# Altium schematic sheet 02_test1.SchDoc
size A3; SheetNumber: 1; SheetTotal: 1
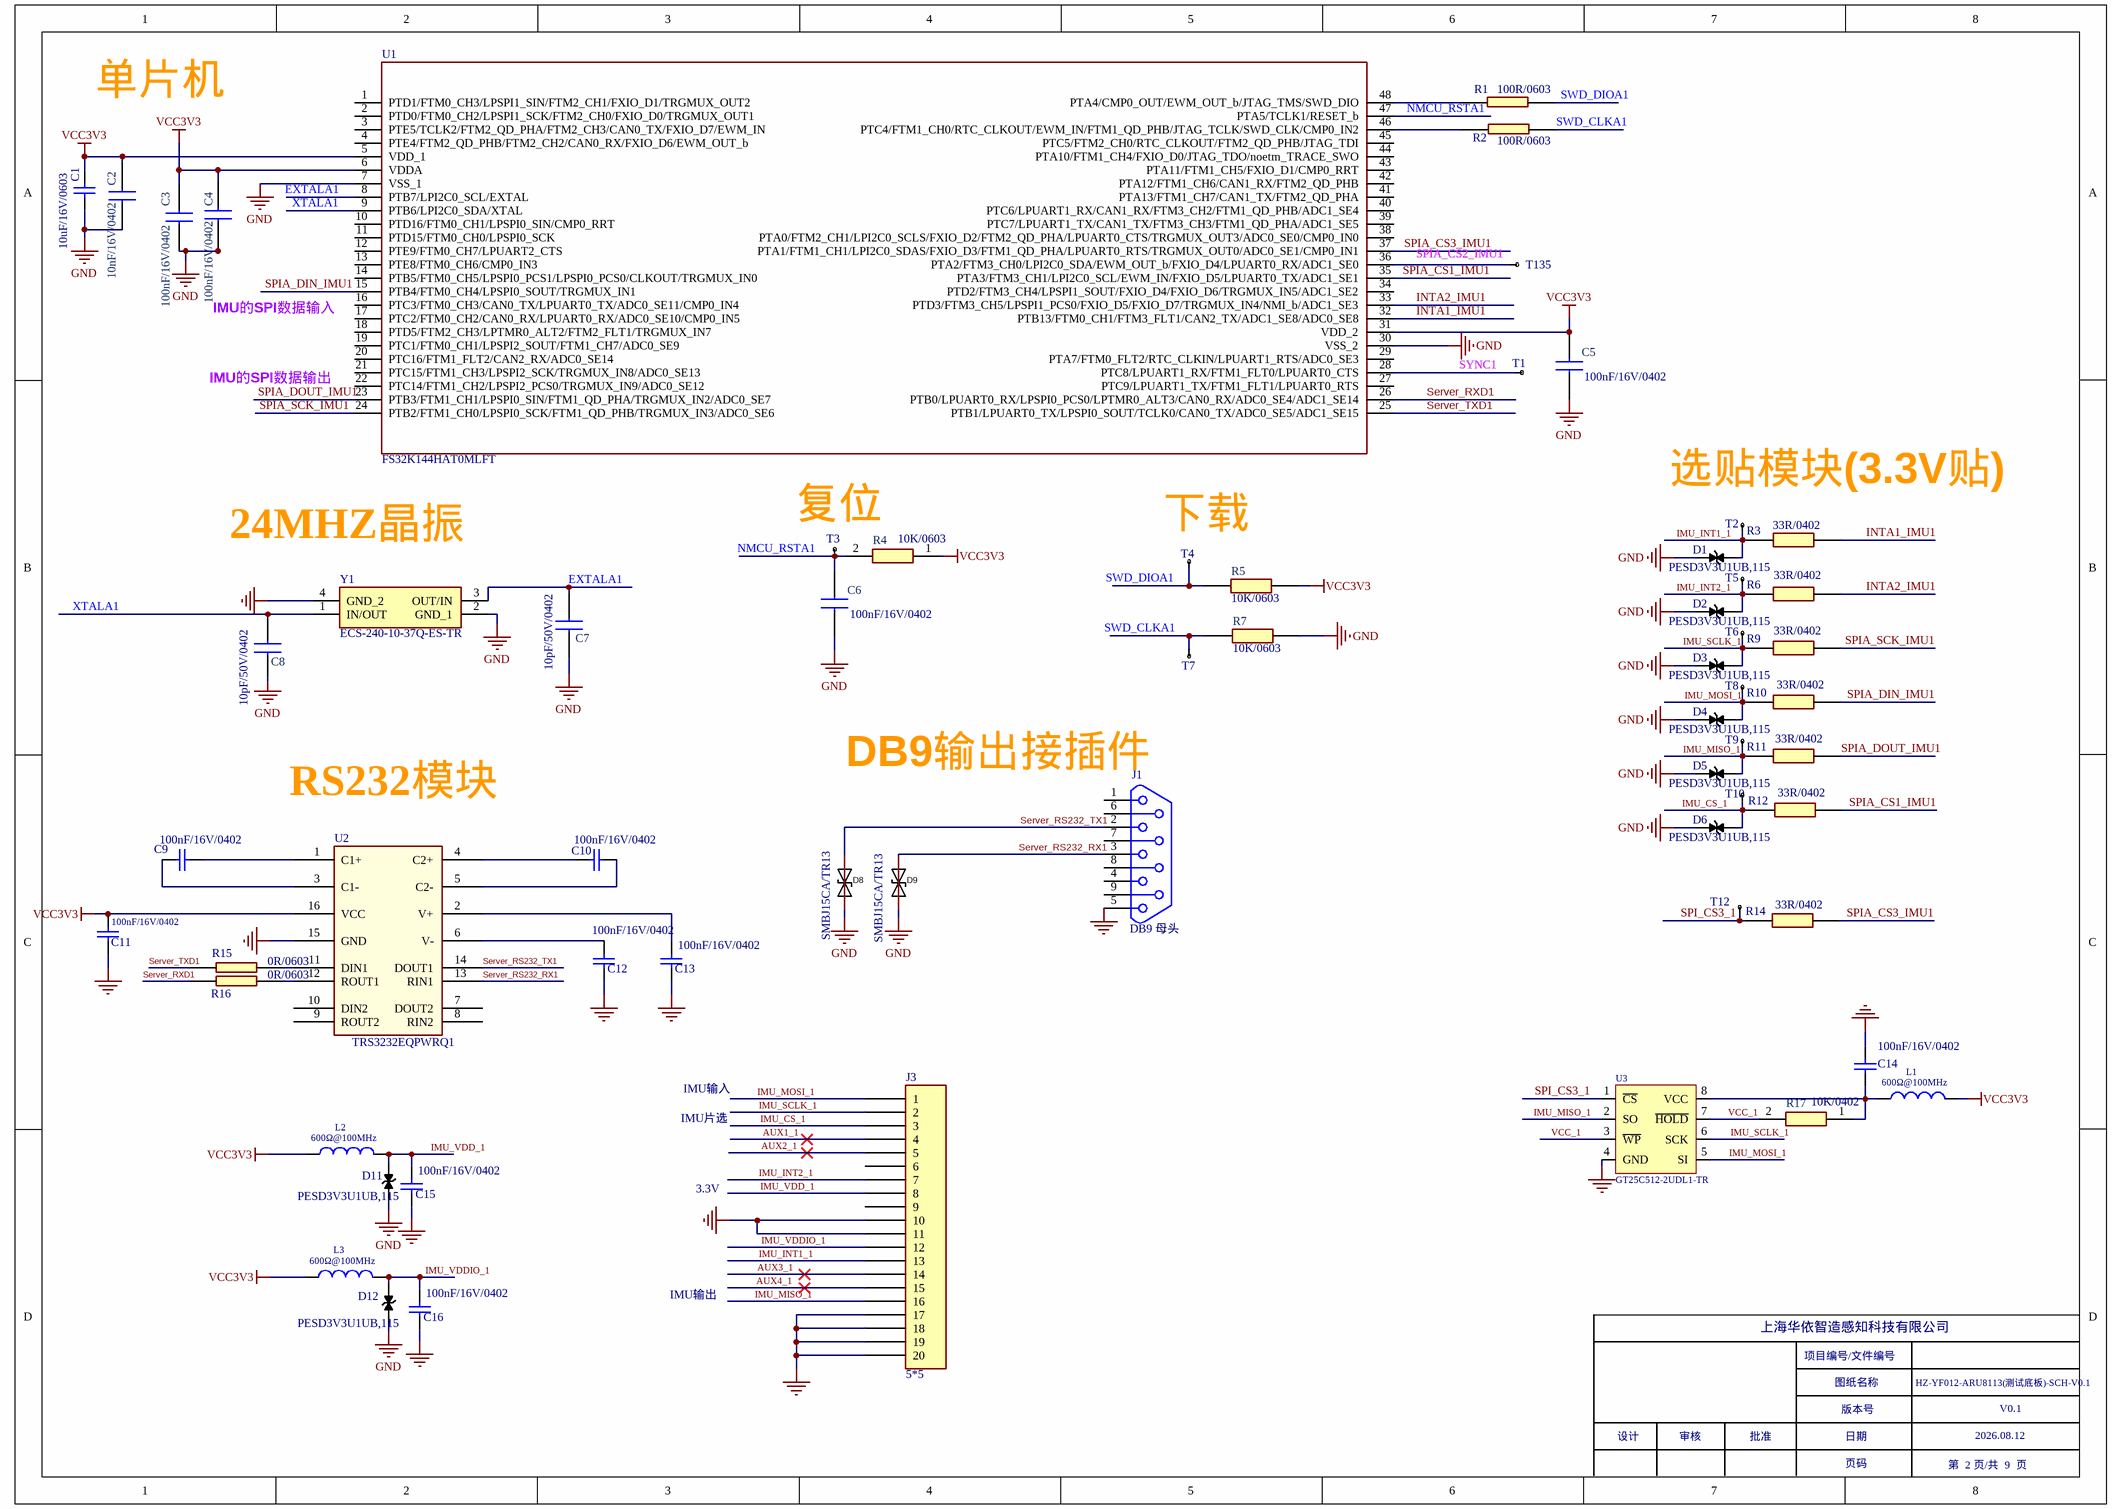
[diagram p0: 02_test1.SchDoc]

## Parts
C1  10uF/16V/0603  [C 0603_L]
C2  10nF/16V/0402  [C 0402_L]
C3  100nF/16V/0402  [C 0402_L]
C4  100nF/16V/0402  [C 0402_L]
C5  100nF/16V/0402  [C 0402_L]
C6  100nF/16V/0402  [C 0402_L]
C7  10pF/50V/0402  [C 0402_L]
C8  10pF/50V/0402  [C 0402_L]
C9  100nF/16V/0402  [C 0402_L]
C10  100nF/16V/0402  [C 0402_L]
C11  value 100nF/16V/0402  [C 0402_L]  (hidden comment: Cap)
C12  100nF/16V/0402  [C 0402_L]
C13  100nF/16V/0402  [C 0402_L]
C14  100nF/16V/0402  [C 0402_L]
C15  100nF/16V/0402  [C 0402_L]
C16  100nF/16V/0402  [0402C]
D1  PESD3V3U1UB,115  [SOD-523]
D2  PESD3V3U1UB,115  [SOD-523]
D3  PESD3V3U1UB,115  [SOD-523]
D4  PESD3V3U1UB,115  [SOD-523]
D5  PESD3V3U1UB,115  [SOD-523]
D6  PESD3V3U1UB,115  [SOD-523]
D8  SMBJ15CA/TR13  [SMB]
D9  SMBJ15CA/TR13  [SMB]
D11  PESD3V3U1UB,115  [PESD3V3U1UB,115]
D12  PESD3V3U1UB,115  [PESD3V3U1UB,115]
J1  DB9 母头  [DB9-RS8R1-2R77]
J3  5*5  [5*5-socket]
L1  value 600Ω@100MHz  [0603L]  (hidden comment: Inductor)
L2  value 600Ω@100MHz  [0603L]  (hidden comment: Inductor)
L3  value 600Ω@100MHz  [0603L]  (hidden comment: Inductor)
R1  100R/0603  [R 0603_L]
R2  100R/0603  [R 0603_L]
R3  33R/0402  [0402R]
R4  10K/0603  [R 0603_L]
R5  10K/0603  [R 0603_L]
R6  33R/0402  [0402R]
R7  10K/0603  [R 0603_L]
R9  33R/0402  [0402R]
R10  33R/0402  [0402R]
R11  33R/0402  [0402R]
R12  33R/0402  [0402R]
R14  33R/0402  [0402R]
R15  0R/0603  [R 0603_L]
R16  0R/0603  [R 0603_L]
R17  10K/0402  [0402R]
T1  TEST  [Test-0.5mm]  (value not drawn)
T2  TEST  [TEST]  (value not drawn)
T3  TEST  [TEST]  (value not drawn)
T4  TEST  [TEST]  (value not drawn)
T5  TEST  [TEST]  (value not drawn)
T6  TEST  [TEST]  (value not drawn)
T7  TEST  [TEST]  (value not drawn)
T8  TEST  [TEST]  (value not drawn)
T9  TEST  [TEST]  (value not drawn)
T10  TEST  [TEST]  (value not drawn)
T12  TEST  [Test-0.5mm]  (value not drawn)
T135  TEST  [Test-0.5mm]  (value not drawn)
U1  FS32K144HAT0MLFT  [LQFP48_7X7]
U2  TRS3232EQPWRQ1  [TSSOP16_640X500]
U3  GT25C512-2UDL1-TR  [GT25C512-2UDLA2-TR]
Y1  ECS-240-10-37Q-ES-TR  [ECS2401037QESTR]

## Nets
GND: C1.2 C2.1 C3.2 C4.2 C5.2 C6.2 C7.1 C8.1 C11.2 C12.2 C13.2 C14.1 C15.2 C16.2 D1.1 D2.1 D3.1 D4.1 D5.1 D6.1 D8.1 D9.1 D11.1 D12.1 J1.5 J3.10 J3.11 J3.17 J3.18 J3.19 J3.20 R7.1 U1.7(VSS_1) U1.30(VSS_2) U2.15(GND) U3.4(GND) Y1.2(GND_1) Y1.4(GND_2)
VCC3V3: C1.1 C2.2 C3.1 C4.1 C5.1 C11.1 L1.2 L2.1 L3.1 R4.1 R5.1 U1.5(VDD_1) U1.6(VDDA) U1.31(VDD_2) U2.16(VCC)
AUX1_1: J3.4
AUX2_1: J3.5
AUX3_1: J3.14
AUX4_1: J3.15
EXTALA1: C7.2 U1.8(PTB7/LPI2C0_SCL/EXTAL) Y1.3(OUT/IN)
IMU_CS_1: D6.2 J3.3 R12.2 T10.1
IMU_INT1_1: D1.2 J3.13 R3.2 T2.1
IMU_INT2_1: D2.2 J3.7 R6.2 T5.1
IMU_MISO_1: D5.2 J3.16 R11.2 T9.1 U3.2(SO)
IMU_MOSI_1: D4.2 J3.1 R10.2 T8.1 U3.5(SI)
IMU_SCLK_1: D3.2 J3.2 R9.2 T6.1 U3.6(SCK)
IMU_VDD_1: C15.1 D11.2 J3.8 L2.2
IMU_VDDIO_1: C16.1 D12.2 J3.12 L3.2
INTA1_IMU1: R3.1 U1.32(PTB13/FTM0_CH1/FTM3_FLT1/CAN2_TX/ADC1_SE8/ADC0_SE8)
INTA2_IMU1: R6.1 U1.33(PTD3/FTM3_CH5/LPSPI1_PCS0/FXIO_D5/FXIO_D7/TRGMUX_IN4/NMI_b/ADC1_SE3)
NMCU_RSTA1: C6.1 R4.2 T3.1 U1.47(PTA5/TCLK1/RESET_b)
Server_RS232_RX1: D9.2 J1.3 U2.13(RIN1)
Server_RS232_TX1: D8.2 J1.2 U2.14(DOUT1)
Server_RXD1: R16.1 U1.26(PTB0/LPUART0_RX/LPSPI0_PCS0/LPTMR0_ALT3/CAN0_RX/ADC0_SE4/ADC1_SE14)
Server_TXD1: R15.1 U1.25(PTB1/LPUART0_TX/LPSPI0_SOUT/TCLK0/CAN0_TX/ADC0_SE5/ADC1_SE15)
SPI_CS3_1: R14.2 T12.1 U3.1(~{CS})
SPIA_CS1_IMU1: R12.1 U1.35(PTA3/FTM3_CH1/LPI2C0_SCL/EWM_IN/FXIO_D5/LPUART0_TX/ADC1_SE1)
SPIA_CS3_IMU1: R14.1 U1.37(PTA1/FTM1_CH1/LPI2C0_SDAS/FXIO_D3/FTM1_QD_PHA/LPUART0_RTS/TRGMUX_OUT0/ADC0_SE1/CMP0_IN1)
SPIA_DIN_IMU1: R10.1 U1.15(PTB4/FTM0_CH4/LPSPI0_SOUT/TRGMUX_IN1)
SPIA_DOUT_IMU1: R11.1 U1.23(PTB3/FTM1_CH1/LPSPI0_SIN/FTM1_QD_PHA/TRGMUX_IN2/ADC0_SE7)
SPIA_SCK_IMU1: R9.1 U1.24(PTB2/FTM1_CH0/LPSPI0_SCK/FTM1_QD_PHB/TRGMUX_IN3/ADC0_SE6)
SWD_CLKA1: R2.2 R7.2 T7.1
SWD_DIOA1: R1.2 R5.2 T4.1
SYNC1: T1.1 U1.28(PTC8/LPUART1_RX/FTM1_FLT0/LPUART0_CTS)
VCC_1: R17.2 U3.3(~{WP}) U3.7(~{HOLD})
XTALA1: C8.2 U1.9(PTB6/LPI2C0_SDA/XTAL) Y1.1(IN/OUT)
NetC9_1: C9.1 U2.3(C1-)
NetC9_2: C9.2 U2.1(C1+)
NetC10_1: C10.1 U2.4(C2+)
NetC10_2: C10.2 U2.5(C2-)
NetC12_1: C12.1 U2.6(V-)
NetC13_1: C13.1 U2.2(V+)
NetC14_2: C14.2 L1.1 R17.1 U3.8(VCC)
NetR1_1: R1.1 U1.48(PTA4/CMP0_OUT/EWM_OUT_b/JTAG_TMS/SWD_DIO)
NetR2_1: R2.1 U1.46(PTC4/FTM1_CH0/RTC_CLKOUT/EWM_IN/FTM1_QD_PHB/JTAG_TCLK/SWD_CLK/CMP0_IN2)
NetR15_2: R15.2 U2.11(DIN1)
NetR16_2: R16.2 U2.12(ROUT1)
NetT135_1: T135.1 U1.36(PTA2/FTM3_CH0/LPI2C0_SDA/EWM_OUT_b/FXIO_D4/LPUART0_RX/ADC1_SE0)

Not connected (* = marked no-connect by the designer): J1 1 4 6 7 8 9; J3 6 9; U1 1(PTD1/FTM0_CH3/LPSPI1_SIN/FTM2_CH1/FXIO_D1/TRGMUX_OUT2) 2(PTD0/FTM0_CH2/LPSPI1_SCK/FTM2_CH0/FXIO_D0/TRGMUX_OUT1) 3(PTE5/TCLK2/FTM2_QD_PHA/FTM2_CH3/CAN0_TX/FXIO_D7/EWM_IN) 4(PTE4/FTM2_QD_PHB/FTM2_CH2/CAN0_RX/FXIO_D6/EWM_OUT_b) 10(PTD16/FTM0_CH1/LPSPI0_SIN/CMP0_RRT) 11(PTD15/FTM0_CH0/LPSPI0_SCK) 12(PTE9/FTM0_CH7/LPUART2_CTS) 13(PTE8/FTM0_CH6/CMP0_IN3) 14(PTB5/FTM0_CH5/LPSPI0_PCS1/LPSPI0_PCS0/CLKOUT/TRGMUX_IN0) 16(PTC3/FTM0_CH3/CAN0_TX/LPUART0_TX/ADC0_SE11/CMP0_IN4) 17(PTC2/FTM0_CH2/CAN0_RX/LPUART0_RX/ADC0_SE10/CMP0_IN5) 18(PTD5/FTM2_CH3/LPTMR0_ALT2/FTM2_FLT1/TRGMUX_IN7) 19(PTC1/FTM0_CH1/LPSPI2_SOUT/FTM1_CH7/ADC0_SE9) 20(PTC16/FTM1_FLT2/CAN2_RX/ADC0_SE14) 21(PTC15/FTM1_CH3/LPSPI2_SCK/TRGMUX_IN8/ADC0_SE13) 22(PTC14/FTM1_CH2/LPSPI2_PCS0/TRGMUX_IN9/ADC0_SE12) 27(PTC9/LPUART1_TX/FTM1_FLT1/LPUART0_RTS) 29(PTA7/FTM0_FLT2/RTC_CLKIN/LPUART1_RTS/ADC0_SE3) 34(PTD2/FTM3_CH4/LPSPI1_SOUT/FXIO_D4/FXIO_D6/TRGMUX_IN5/ADC1_SE2) 38(PTA0/FTM2_CH1/LPI2C0_SCLS/FXIO_D2/FTM2_QD_PHA/LPUART0_CTS/TRGMUX_OUT3/ADC0_SE0/CMP0_IN0) 39(PTC7/LPUART1_TX/CAN1_TX/FTM3_CH3/FTM1_QD_PHA/ADC1_SE5) 40(PTC6/LPUART1_RX/CAN1_RX/FTM3_CH2/FTM1_QD_PHB/ADC1_SE4) 41(PTA13/FTM1_CH7/CAN1_TX/FTM2_QD_PHA) 42(PTA12/FTM1_CH6/CAN1_RX/FTM2_QD_PHB) 43(PTA11/FTM1_CH5/FXIO_D1/CMP0_RRT) 44(PTA10/FTM1_CH4/FXIO_D0/JTAG_TDO/noetm_TRACE_SWO) 45(PTC5/FTM2_CH0/RTC_CLKOUT/FTM2_QD_PHB/JTAG_TDI); U2 7(DOUT2) 8(RIN2) 9(ROUT2) 10(DIN2)

## Notes on the sheet
- 单片机
- IMU的SPI数据输入
- IMU的SPI数据输出
- 选贴模块(3.3V贴)
- (near Y1) 24MHZ晶振
- (near T3) 复位
- (near T4) 下载
- DB9输出接插件
- (near U2) RS232模块
- IMU片选
- IMU输入
- 3.3V
- IMU输出
- 上海华依智造感知科技有限公司
- 项目编号/文件编号
- 图纸名称
- HZ-YF012-ARU8113(测试底板)-SCH-V0.1
- 设计
- 审核
- 批准
- 版本号
- 日期
- 2026.08.12
- V0.1
- 页码
- 第  2 页/共  9  页
- Labels drawn without touching a wire or pin: SPIA_CS2_IMU1

## Library data of the parts
C1 = Cap: SMD/SMT 10UF 16V 20% 0603; Published: 8-Jun-2000; LatestRevisionDate: 17-Jul-2002; LatestRevisionNote: Re-released for DXP Platform.; PackageReference: RAD-0.3; Publisher: Altium Limited; PackageDescription: Radial Cap, Thru-Hole; 2 Leads; 0.3 in Pin Spacing; Value: 10uF/16V
C2-C8 = 0402Capacitor: Capacitor; Manufacturer_Name: Murata Electronics; Manufacturer_Part_Number: GCM155R71C104KA55D; Datasheet Link: https://componentsearchengine.com//GCM155R71C104KA55D.pdf; Height: 0.55mm; Mouser2 Part Number: 81-GCM155R71C104KA5D; Mouser2 Price/Stock: https://www.mouser.com/Search/Refine.aspx?Keyword=81-GCM155R71C104KA5D
C9-C16 = Cap: '100nF/16V/10%/ 0402/X7R / -55℃ ～ 125℃/AEC-Q200; Published: 8-Jun-2000; LatestRevisionDate: 17-Jul-2002; LatestRevisionNote: Re-released for DXP Platform.; PackageReference: RAD-0.3; Publisher: Altium Limited; PackageDescription: Radial Cap, Thru-Hole; 2 Leads; 0.3 in Pin Spacing
  C9 C10 C12-C16: Value: 100nF/16V/0402
D1-D6 D11 D12 = SMBJ36CA: 双向TVS管；600W表面贴装瞬态电压抑制器,工作电压36V，SMB_DO-214AA封装 DIODES
D8 D9 = SMBJ15CA/TR13_C78410: Manufacturer: Brightking(君耀电子); Symbol: SMBJ15CA-C78410; Add into BOM: yes; polarity: 双向; Reverse Stand-Off Voltage (Vrwm): 15V; Maximum Clamping Voltage: 24.4V; Peak Pulse Current (Ipp)@10/1000us: 24.6A; Peak Pulse Power Dissipation (Ppp)@10/1000us: 600W; Breakdown Voltage: 16.7V; Type: TVS; Device: SMBJ15CA/TR13_C78410; LCSC Part Name: 双向 15V截止 24.6A峰值脉冲; Supplier Part: C78410; Manufacturer Part: SMBJ15CA/TR13; Supplier Footprint: SMB(DO-214AA); JLCPCB Part Class: Extended Part; Datasheet: https://atta.szlcsc.com/upload/public/pdf/source/20181127/C309995_EB3DFB9F9AEE5D2146ECD9FA5992A402.pdf; Supplier: LCSC; Convert to PCB: yes
J1 = DB9
L1-L3 = Inductor: Code_IEC: 1005; Published: 8-Jun-2000; LatestRevisionDate: 29-May-2009; LatestRevisionNote: IPC-7351 Footprint Added.; PackageReference: 0402-A; Publisher: Altium Limited; PackageDescription: Chip Inductor; Code_JEITA: 0402
R1 R2 R15 R16 = 0402
R3-R7 R9-R12 R14 R17 = 0402Resistor: Resistor; Manufacturer_Name: KOA Speer; Manufacturer_Part_Number: RN73H1ETTP1002F50; Datasheet Link: https://www.mouser.fr/datasheet/2/219/RN73H-12200.pdf; Height: 0.4mm
U1 = FS32K144HAT0MLFT: Integrated Circuit; Manufacturer_Name: NXP; Datasheet Link: http://www.nxp.com/docs/en/data-sheet/S32K-DS.pdf; Height: 1.6mm; Manufacturer_Part_Number: FS32K144HAT0MLFT
U3 = GT25C512-2UDLA2-TR
Y1 = ECS-240-10-37Q-ES-TR: Crystal or Oscillator; Manufacturer_Name: ECS; Datasheet Link: https://www.ecsxtal.com/store/pdf/ECX-1637Q.pdf; Height: 0.55mm; Manufacturer_Part_Number: ECS-240-10-37Q-ES-TR